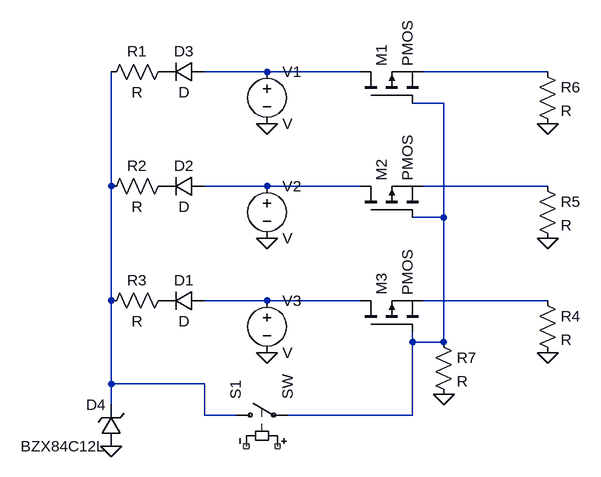
[diagram p0: schematic Draft2.asc]
Draft2.asc, the LTspice schematic file:
Version 4
SHEET 1 880 680
WIRE 0 -48 -96 -48
WIRE 144 -48 0 -48
WIRE 432 -48 240 -48
WIRE 272 0 224 0
WIRE -240 128 -240 -48
WIRE 0 128 -96 128
WIRE 144 128 0 128
WIRE 432 128 240 128
WIRE 272 176 272 0
WIRE 272 176 224 176
WIRE -240 304 -240 128
WIRE 0 304 -96 304
WIRE 144 304 0 304
WIRE 432 304 240 304
WIRE 224 368 224 352
WIRE 272 368 272 176
WIRE 272 368 224 368
WIRE -240 432 -240 304
WIRE -96 432 -240 432
WIRE -240 464 -240 432
WIRE -96 480 -96 432
WIRE -48 480 -96 480
WIRE 224 480 224 368
WIRE 224 480 32 480
FLAG 0 32 0
FLAG 0 208 0
FLAG 0 384 0
FLAG -240 528 0
FLAG 432 32 0
FLAG 432 208 0
FLAG 432 384 0
FLAG 272 448 0
SYMBOL voltage 0 -64 R0
SYMATTR InstName V1
SYMBOL voltage 0 112 R0
SYMATTR InstName V2
SYMBOL voltage 0 288 R0
SYMATTR InstName V3
SYMBOL pmos 144 0 R270
SYMATTR InstName M1
SYMBOL pmos 144 176 R270
SYMATTR InstName M2
SYMBOL pmos 144 352 R270
SYMATTR InstName M3
SYMBOL diode -96 288 R90
WINDOW 0 0 32 VBottom 2
WINDOW 3 32 32 VTop 2
SYMATTR InstName D1
SYMBOL diode -96 112 R90
WINDOW 0 0 32 VBottom 2
WINDOW 3 32 32 VTop 2
SYMATTR InstName D2
SYMBOL diode -96 -64 R90
WINDOW 0 0 32 VBottom 2
WINDOW 3 32 32 VTop 2
SYMATTR InstName D3
SYMBOL res -144 -64 R90
WINDOW 0 0 56 VBottom 2
WINDOW 3 32 56 VTop 2
SYMATTR InstName R1
SYMBOL res -144 112 R90
WINDOW 0 0 56 VBottom 2
WINDOW 3 32 56 VTop 2
SYMATTR InstName R2
SYMBOL res -144 288 R90
WINDOW 0 0 56 VBottom 2
WINDOW 3 32 56 VTop 2
SYMATTR InstName R3
SYMBOL zener -224 528 R180
WINDOW 0 24 64 Left 2
WINDOW 3 24 0 Left 2
SYMATTR InstName D4
SYMATTR Value BZX84C12L
SYMATTR Description Diode
SYMATTR Type diode
SYMBOL sw -64 480 R270
SYMATTR InstName S1
SYMBOL res 416 288 R0
SYMATTR InstName R4
SYMBOL res 416 112 R0
SYMATTR InstName R5
SYMBOL res 416 -64 R0
SYMATTR InstName R6
SYMBOL res 256 352 R0
SYMATTR InstName R7

The netlist it stands for:
* Draft2.asc
V1 N001 0 V
V2 N005 0 V
V3 N007 0 V
M1 N001 N003 N002 N002 PMOS
M2 N005 N003 N006 N006 PMOS
M3 N007 N003 N008 N008 PMOS
D1 N007 P001 D
D2 N005 P002 D
D3 N001 P003 D
R1 P003 N004 R
R2 P002 N004 R
R3 P001 N004 R
D4 0 N004 BZX84C12L
S1 N004 N003 NC_01 NC_02 SW
R4 N008 0 R
R5 N006 0 R
R6 N002 0 R
R7 N003 0 R
.model D D
.lib standard.dio
.model NMOS NMOS
.model PMOS PMOS
.lib standard.mos
.backanno
.end